# Altium project Phaser.PrjPCB (part 10 of 11)

## Sheet Attenuator.SchDoc: =DocumentName
size A4; SPICEModelCacheVGBTAUBO: <root> / <DocumentId>VGBTAUBO</DocumentId> / </root>; DocumentNumber: 1; Revision: 0; SheetNumber: 24; SheetTotal: 30
Used 4 times, as channels U_Attenuator0, U_Attenuator2, U_Attenuator1, U_Attenuator3. Parts and nets are listed once, with the designators drawn on the sheet.
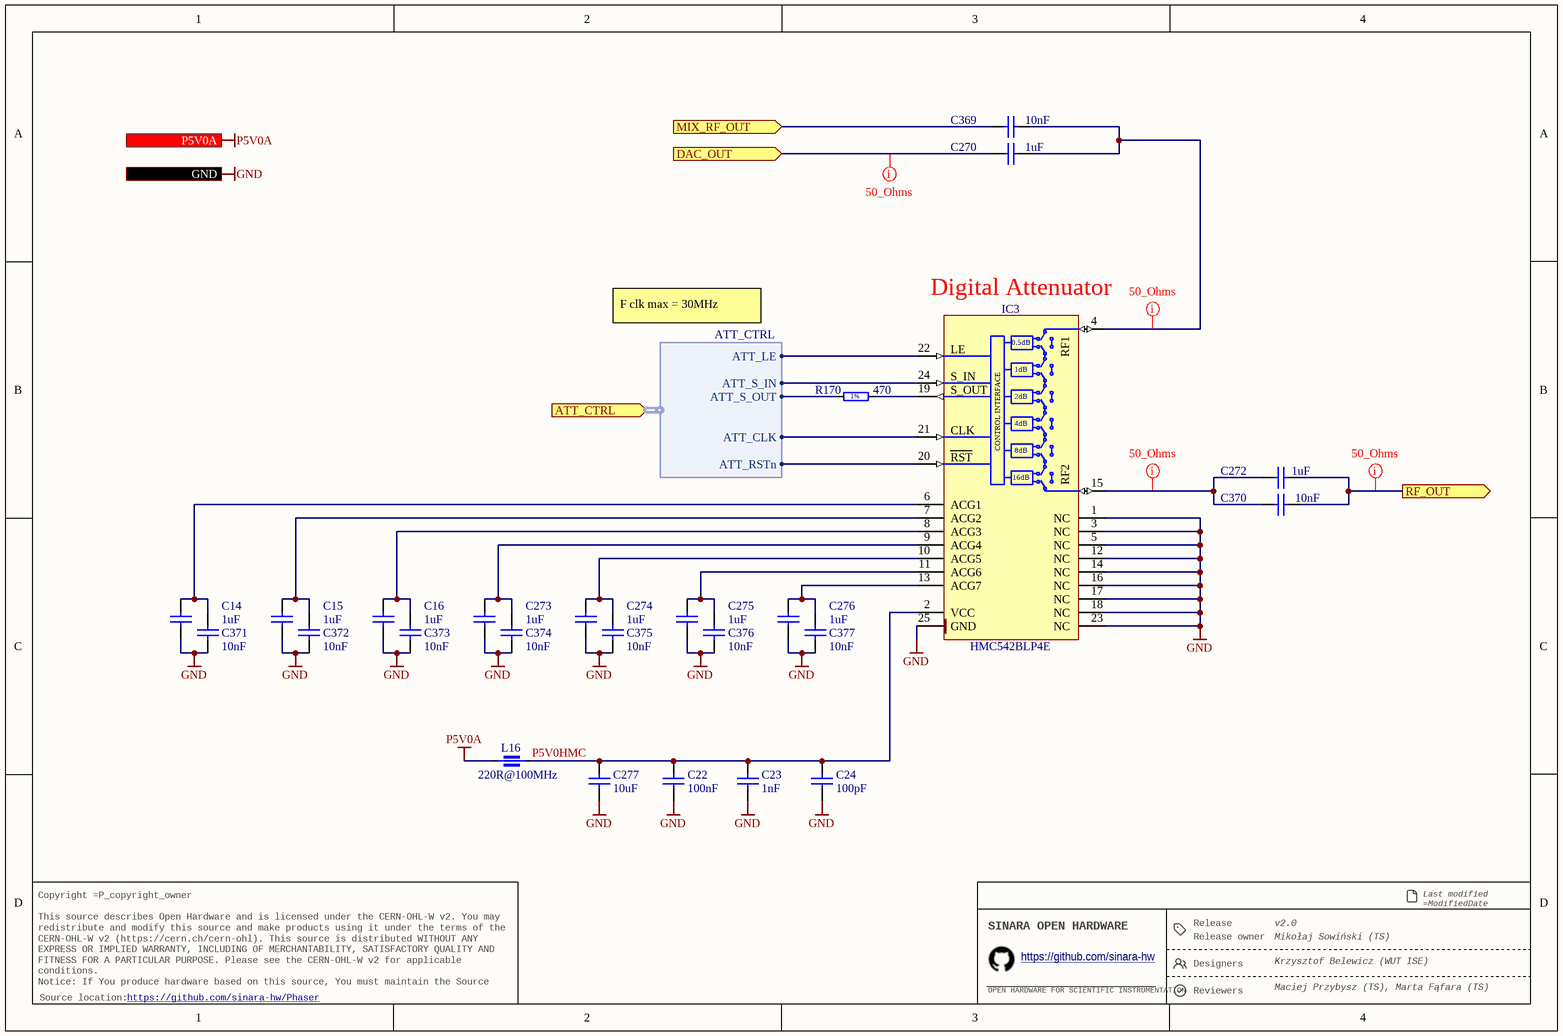
[diagram p28: Attenuator.SchDoc]

### Parts
C14  1uF  [CAPC1005X55N]
C15  1uF  [CAPC1005X55N]
C16  1uF  [CAPC1005X55N]
C22  100nF  [CAPC1005X55N]
C23  1nF  [CAPC1005X55N]
C24  100pF  [CAPC1005X55N]
C270  1uF  [CAPC1005X55N]
C272  1uF  [CAPC1005X55N]
C273  1uF  [CAPC1005X55N]
C274  1uF  [CAPC1005X55N]
C275  1uF  [CAPC1005X55N]
C276  1uF  [CAPC1005X55N]
C277  10uF  [CAPC2012X95N]
C369  10nF  [CAPC1005X55N]
C370  10nF  [CAPC1005X55N]
C371  10nF  [CAPC1005X55N]
C372  10nF  [CAPC1005X55N]
C373  10nF  [CAPC1005X55N]
C374  10nF  [CAPC1005X55N]
C375  10nF  [CAPC1005X55N]
C376  10nF  [CAPC1005X55N]
C377  10nF  [CAPC1005X55N]
IC3  HMC542BLP4E  [QFN50P400X400X100-25N-S295]
L16  220R@100MHz  [INDC1608X95N]
R170  470  [RESC1005X40N]

### Ports
ATT_CTRL (in, harness ATT_CTRL), DAC_OUT (in), GND, MIX_RF_OUT (in), P5V0A (in), RF_OUT (out)

### Harnesses
ATT_CTRL: ATT_CLK, ATT_LE, ATT_RSTn, ATT_S_IN, ATT_S_OUT

### Nets
GND: C14.1 C15.1 C16.1 C22.1 C23.1 C24.1 C273.1 C274.1 C275.1 C276.1 C277.1 C371.2 C372.2 C373.2 C374.2 C375.2 C376.2 C377.2 IC3.1(NC) IC3.3(NC) IC3.5(NC) IC3.12(NC) IC3.14(NC) IC3.16(NC) IC3.17(NC) IC3.18(NC) IC3.23(NC) IC3.25(GND) ; port GND
P5V0A: L16.1 ; port P5V0A
DAC_OUT: C270.2 ; port DAC_OUT
MIX_RF_OUT: C369.1 ; port MIX_RF_OUT
P5V0HMC: C22.2 C23.2 C24.2 C277.2 IC3.2(VCC) L16.2
RF_OUT: C272.1 C370.2 ; port RF_OUT
NetC14_2: C14.2 C371.1 IC3.6(ACG1)
NetC15_2: C15.2 C372.1 IC3.7(ACG2)
NetC16_2: C16.2 C373.1 IC3.8(ACG3)
NetC270_1: C270.1 C369.2 IC3.4(RF1)
NetC272_2: C272.2 C370.1 IC3.15(RF2)
NetC273_2: C273.2 C374.1 IC3.9(ACG4)
NetC274_2: C274.2 C375.1 IC3.10(ACG5)
NetC275_2: C275.2 C376.1 IC3.11(ACG6)
NetC276_2: C276.2 C377.1 IC3.13(ACG7)
NetIC3_19: IC3.19(SERIAL_OUTPUT) R170.2
NetIC3_20: IC3.20(~{RESET}) ; port ATT_CTRL.ATT_RSTn
NetIC3_21: IC3.21(SHIFT_CLOCK) ; port ATT_CTRL.ATT_CLK
NetIC3_22: IC3.22(LATCH_ENABLE) ; port ATT_CTRL.ATT_LE
NetIC3_24: IC3.24(SERIAL_INPUT) ; port ATT_CTRL.ATT_S_IN
NetR170_1: R170.1 ; port ATT_CTRL.ATT_S_OUT

### Channels
U_Attenuator0: designators end in A; ports DAC_OUT=NetC270A_2 GND=GND MIX_RF_OUT=NetC369A_1 P5V0A=P5V0A RF_OUT=NetC272A_1
U_Attenuator2: designators end in C; ports DAC_OUT=NetC270C_2 GND=GND MIX_RF_OUT=GND P5V0A=P5V0A RF_OUT=NetC272C_1
U_Attenuator1: designators end in B; ports DAC_OUT=NetC270B_2 GND=GND MIX_RF_OUT=NetC369B_1 P5V0A=P5V0A RF_OUT=NetC272B_1
U_Attenuator3: designators end in D; ports DAC_OUT=NetC270D_2 GND=GND MIX_RF_OUT=GND P5V0A=P5V0A RF_OUT=NetC272D_1

### Layout directives
net class 50_Ohms: NetC270A_1, NetC270A_2, NetC272A_1, NetC272A_2

### Notes on the sheet
- (near IC3) Digital Attenuator
- F clk max = 30MHz
- Release
- Last modified =ModifiedDate
  Sheet =sheetnumber of =sheettotal · Size A4
- Copyright =P_copyright_owner
  This source describes Open Hardware and is licensed under the CERN-OHL-W v2. You may redistribute and modify this source and make products using it under the terms of the CERN-OHL-W v2 (https://cern.ch/cern-ohl). This source is distributed WITHOUT ANY EXPRESS OR IMPLIED WARRANTY, INCLUDING OF MERCHANTABILITY, SATISFACTORY QUALITY AND FITNESS FOR A PARTICULAR PURPOSE. Please see the CERN-OHL-W v2 for applicable conditions.
  Notice: If You produce hardware based on this source, You must maintain the Source Location visible on the product, its packaging or its documentation.
- SINARA OPEN HARDWARE
- OPEN HARDWARE FOR SCIENTIFIC INSTRUMENTATION
- https://github.com/sinara-hw
- Release owner
- Designers
- Reviewers
- Source location:
- (in symbol HMC542BLP4E) 0.5dB; LE; 1dB; S_IN; S_OUT; 2dB; CONTROL INTERFACE; 4dB; CLK; 8dB; RST; 16dB
- (in symbol R0402_470R_1%_0.0625W_100PPM) 1%

### Library data of the parts
C14-C16 C270 C272-C276 = CC0402_1UF_16V_10%_X5R: Non-polarised capacitor; Part Description: SMD Multilayer Chip Ceramic Capacitor; Manufacturer: GENERIC; Manufacturer1 Part Number: C1005X5R1C105KT; Voltage: 16V; TC: X5R; Tolerance: ±10%; Part Number: CC0402_1UF_16V_10%_X5R; Component Kind: Standard; Component Type: Standard; Pin Count: 2; Value: 1uF; Status: Preferred; Manufacturer Part Number: CC0402_1UF_16V_10%_X5R; Case: 0402; Mounted: Yes; Socket: No; SMD: Yes; Sense: No; Manufacturer1 Example: TDK; Manufacturer1 ComponentHeight: 0.55mm; HelpURL: \\cern.ch\dfs\Applications\Altium\Datasheets\CC0402_X5R_TDK_C.pdf; Author: CERN DEM JLC; CreateDate: 25.10.2012; LatestRevisionDate: 25.10.2012
C22 = CC0402_100NF_50V_10%_X7R: Non-polarised capacitor; Part Description: SMD Multilayer Chip Ceramic Capacitor; Manufacturer: GENERIC; Manufacturer1 Part Number: GRM155R71H104KE14D; Voltage: 50V; TC: X7R; Tolerance: ±10%; Part Number: CC0402_100NF_50V_10%_X7R; Component Kind: Standard; Component Type: Standard; Pin Count: 2; Value: 100nF; Status: None; Manufacturer Part Number: CC0402_100NF_50V_10%_X7R; Case: 0402; Mounted: Yes; Socket: No; SMD: Yes; Sense: No; Manufacturer1 Example: MURATA; Manufacturer1 ComponentHeight: 0.55mm; HelpURL: \\cern.ch\dfs\Applications\Altium\Datasheets\CC0402_MURATA_GRM155R71H104KE14D.pdf; Author: CERN DEM MR; CreateDate: 30.06.2017; LatestRevisionDate: 30.06.2017
C23 = CC0402_1NF_50V_10%_X7R: Non-polarised capacitor; Part Description: SMD Multilayer Chip Ceramic Capacitor; Manufacturer: GENERIC; Manufacturer1 Part Number: 223858715623; Voltage: 50V; TC: X7R; Tolerance: ±10%; Part Number: CC0402_1NF_50V_10%_X7R; Component Kind: Standard; Component Type: Standard; Pin Count: 2; Value: 1nF; Status: Not Recommended; Manufacturer Part Number: CC0402_1NF_50V_10%_X7R; Case: 0402; Mounted: Yes; Socket: No; SMD: Yes; Sense: No; Manufacturer1 Example: PHYCOMP; Manufacturer1 ComponentHeight: 0.55mm; HelpURL: \\cern.ch\dfs\Applications\Altium\Datasheets\CC0402_X7R_PHYCOMP.pdf; Author: CERN DEM JLC; CreateDate: 2007-12-03; LatestRevisionDate: 2007-12-03
C24 = CC0402_100PF_50V_5%_C0G: Non-polarised capacitor; Part Description: SMD Multilayer Chip Ceramic Capacitor; Manufacturer: GENERIC; Manufacturer1 Part Number: C0402C101J5GACTU; Voltage: 50V; TC: C0G/NP0; Tolerance: ±5%; Part Number: CC0402_100PF_50V_5%_C0G; Component Kind: Standard; Component Type: Standard; Pin Count: 2; Value: 100pF; Status: Preferred; Manufacturer Part Number: CC0402_100PF_50V_5%_C0G; Case: 0402; Mounted: Yes; Socket: No; SMD: Yes; Sense: No; Manufacturer1 Example: KEMET; Manufacturer1 ComponentHeight: 0.55mm; HelpURL: \\cern.ch\dfs\Applications\Altium\Datasheets\CC0805_C0G_KEMET_(Commercial Grade).pdf; Author: CERN DEM JLC; CreateDate: 2007-12-03; LatestRevisionDate: 2015-04-22
C277 = CC0805_10UF_25V_10%_X5R: Non-polarised capacitor; Part Description: SMD Multilayer Chip Ceramic Capacitor; Manufacturer: GENERIC; Manufacturer1 Part Number: GRM219R61E106KA12D; Voltage: 25V; TC: X5R; Tolerance: ±10%; Part Number: CC0805_10UF_25V_10%_X5R; Component Kind: Standard; Component Type: Standard; Pin Count: 2; Value: 10uF; Status: Preferred; Manufacturer Part Number: CC0805_10UF_25V_10%_X5R; Case: 0805; Mounted: Yes; Socket: No; SMD: Yes; Sense: No; Manufacturer1 Example: MURATA; Manufacturer1 ComponentHeight: 0.95mm; HelpURL: \\cern.ch\dfs\Applications\Altium\Datasheets\CC0805_X5R_MURATA_GRM.pdf; Author: CERN DEM JLC; CreateDate: 25.10.2012; LatestRevisionDate: 06.09.2016
C369-C377 = CC0402_10NF_50V_5%_X7R: Non-polarised capacitor; Part Description: SMD Multilayer Chip Ceramic Capacitor; Manufacturer: GENERIC; Manufacturer1 Part Number: C0402C103J5RAC; Voltage: 50V; TC: X7R; Tolerance: ±5%; Part Number: CC0402_10NF_50V_5%_X7R; Component Kind: Standard; Component Type: Standard; Pin Count: 2; Value: 10nF; Status: Preferred; Manufacturer Part Number: CC0402_10NF_50V_5%_X7R; Case: 0402; Mounted: Yes; Socket: No; SMD: Yes; Sense: No; Manufacturer1 Example: KEMET; Manufacturer1 ComponentHeight: 0.55mm; HelpURL: \\cern.ch\dfs\Applications\Altium\Datasheets\CC0402_X7R_KEMET.pdf; Author: CERN DEM BC; CreateDate: 15.07.2020; LatestRevisionDate: 15.07.2020
IC3 = HMC542BLP4E: 0.5dB LSB GaAs MMIC 6-bit Digital Serial Control Attenuator, DC - 4GHz; Part Description: 0.5dB LSB GaAs MMIC 6-bit Digital Serial Control Attenuator, DC to 4GHz; Manufacturer: HITTITE MICROWAVE CORP; PressFit: No; Bonding: No; Part Number: HMC542BLP4E; Component Kind: Standard; Component Type: Standard; Device: HMC542BLP4E; PackageDescription: QFN, 0.50mm Pitch, Square; 24 Pin, 4.00mm L X 4.00mm W X 1.00mm H Body (w/thermal Tab 2.95 X 2.95mm), IPC Medium Density; Manufacturer Part Number: HMC542BLP4E; Pin Count: 25; Case: QFN24; Mounted: Yes; Socket: No; SMD: Yes; Sense: No; ComponentHeight: 1mm; Author: CERN DEM JMW; HelpURL: \\cern.ch\dfs\Applications\Altium\Datasheets\HMC542BLP4E.pdf; CreateDate: 2016-08-17; LatestRevisionDate: 2016-08-17
L16 = IND0603_MURATA_BLM18SG221TN1: Part Description: SMD EMIFIL Suppression Chip Ferrite Bead; Manufacturer: MURATA; Power: 2.5A; Resistance: 0.04R; Tolerance: ±25%; Part Number: IND0603_MURATA_BLM18SG221TN1; Component Kind: Standard; Component Type: Standard; Pin Count: 2; Value: 220R@100MHz; Status: None; Manufacturer Part Number: BLM18SG221TN1; Case: 0603; Mounted: Yes; Socket: No; SMD: Yes; Sense: No; ComponentHeight: 0.95mm; HelpURL: \\cern.ch\dfs\Applications\Altium\Datasheets\IND0603_MURATA_BLM18S.pdf; Author: CERN DEM MR; CreateDate: 08.01.2016; LatestRevisionDate: 25.10.2018
R170 = R0402_470R_1%_0.0625W_100PPM: Resistor - 1%; Part Description: General Purpose Thick Film Chip Resistor; Manufacturer: GENERIC; Manufacturer1 Part Number: 232270674701L; TC: ±100ppm/°C; PressFit: No; Part Number: R0402_470R_1%_0.0625W_100PPM; Component Kind: Standard; Component Type: Standard; Pin Count: 2; Value: 470; Status: Not Recommended; Power: 0.0625W; Tolerance: ±1%; Manufacturer Part Number: R0402_470R_1%_0.0625W_100PPM; Case: 0402; Mounted: Yes; Sense: No; Socket: No; SMD: Yes; Manufacturer1 Example: YAGEO PHYCOMP; Manufacturer1 ComponentHeight: 0.4mm; HelpURL: \\cern.ch\dfs\Applications\Altium\Datasheets\R0402_Phycomp_RC0402.pdf; Author: CERN DEM JLC; CreateDate: 03.12.2007; LatestRevisionDate: 17.10.2012

## Sheet JTAG_Switch.SchDoc: =DocumentName
size A3; SPICEModelCacheVGBTAUBO: <root> / <DocumentId>VGBTAUBO</DocumentId> / </root>; DocumentNumber: 1; Revision: 0; SheetNumber: 11; SheetTotal: 30
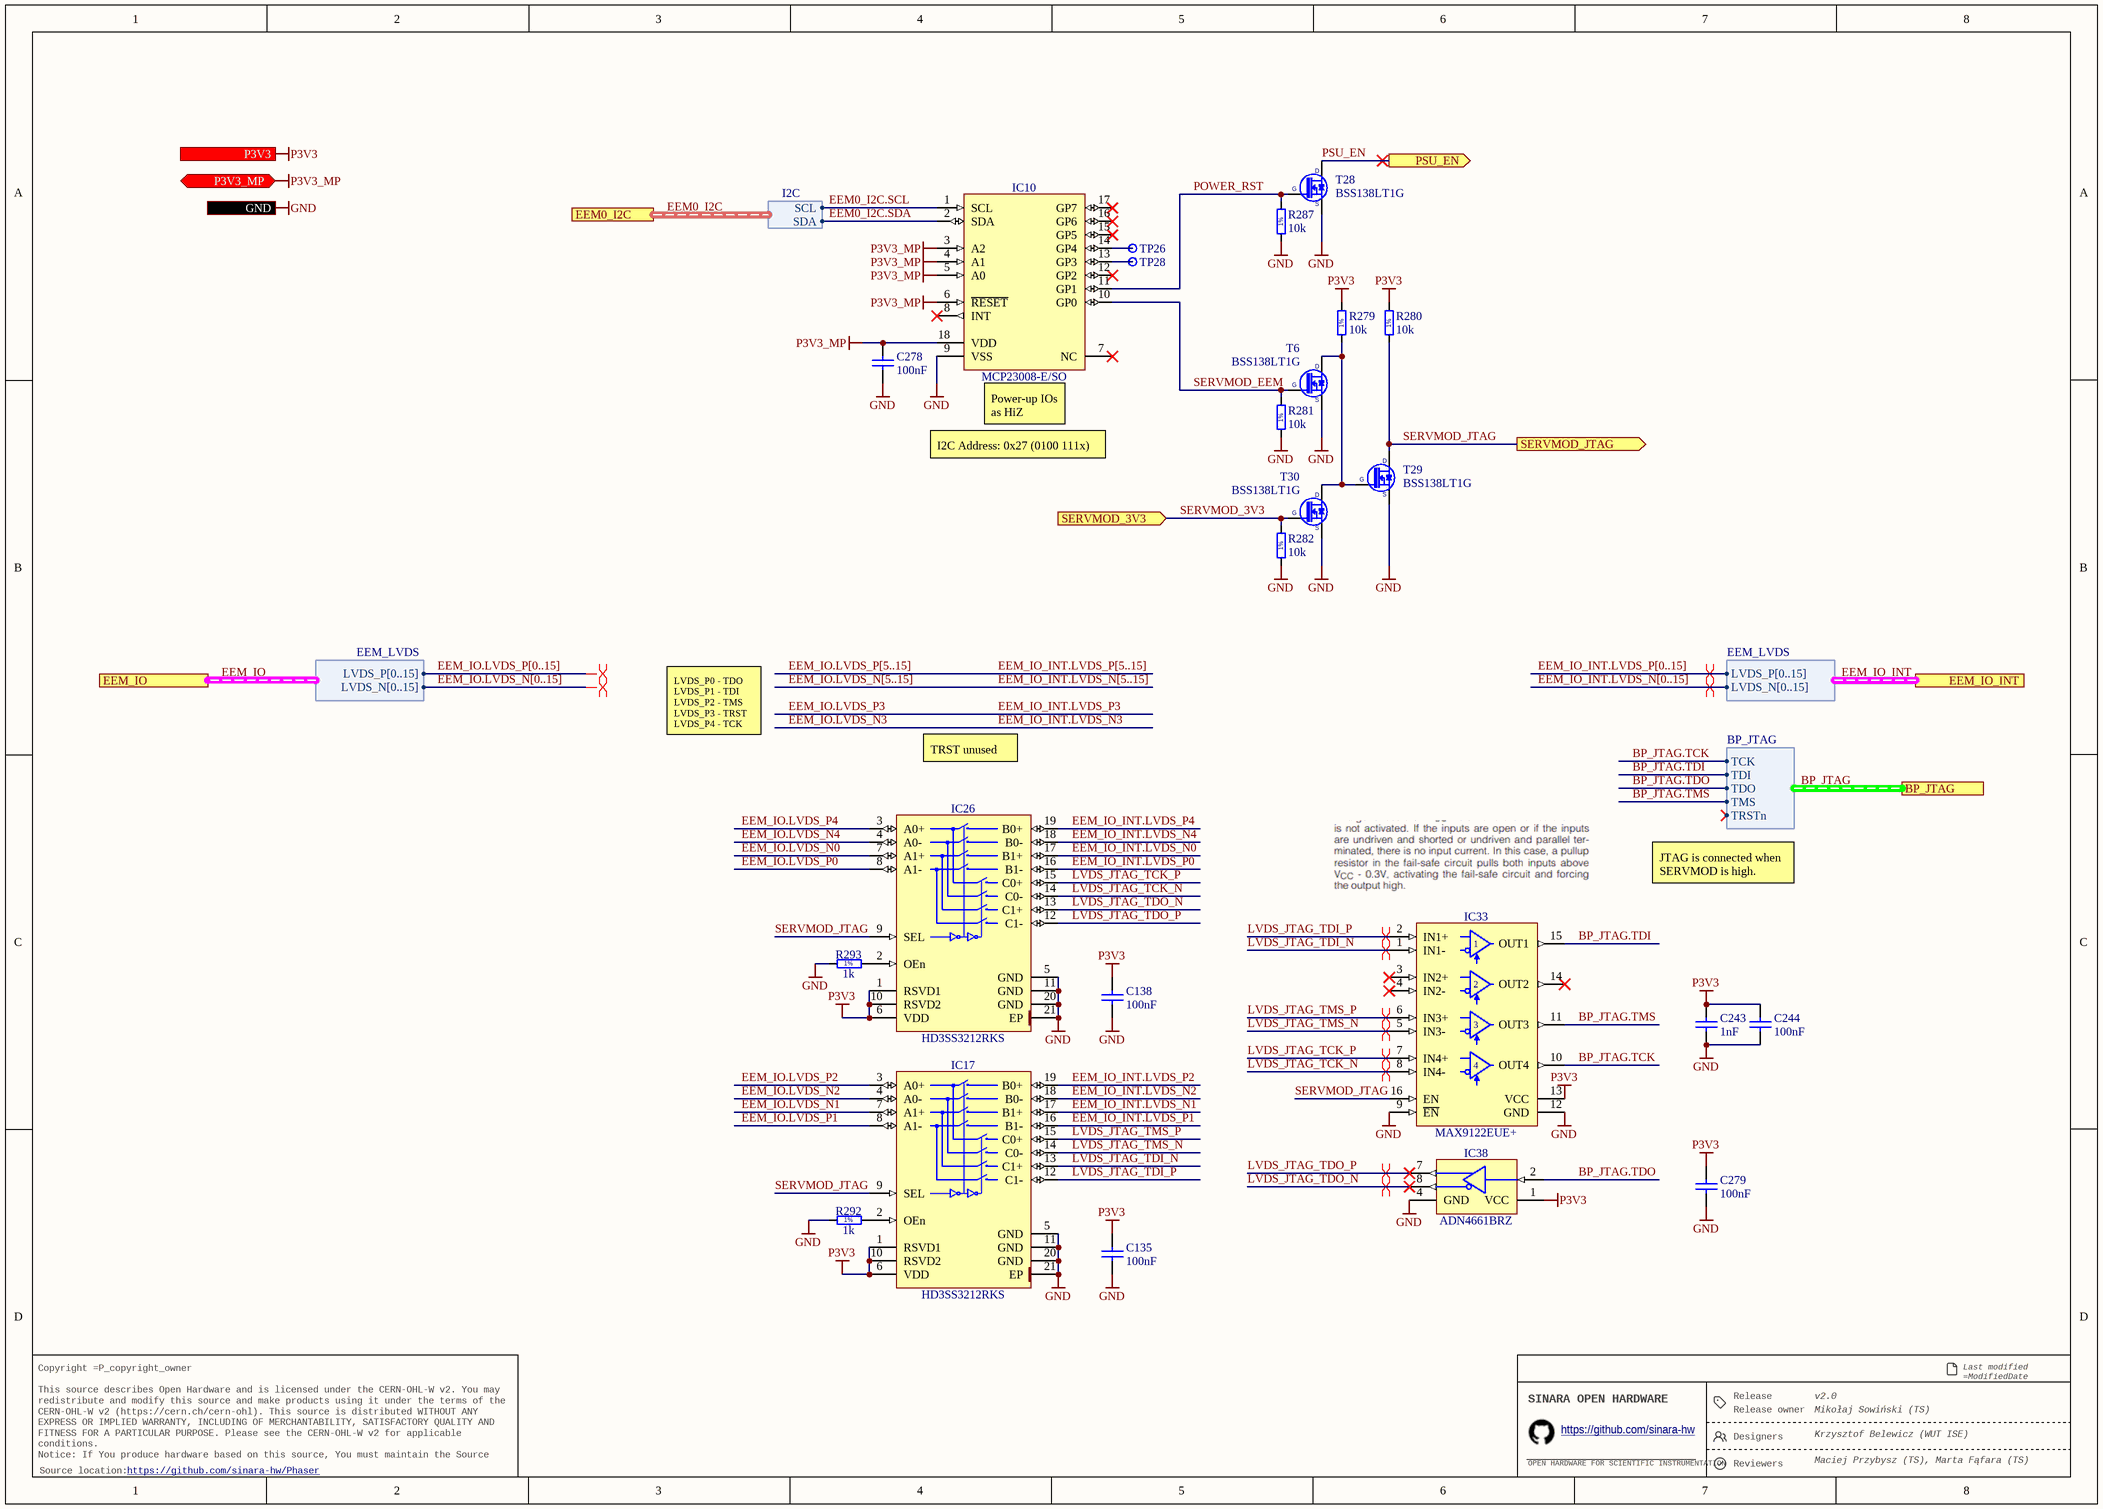
[diagram p29: JTAG_Switch.SchDoc]

### Parts
C135  100nF  [CAPC1005X55N]
C138  100nF  [CAPC1005X55N]
C243  1nF  [CAPC1005X55N]
C244  100nF  [CAPC1005X55N]
C278  100nF  [CAPC1005X55N]
C279  100nF  [CAPC1005X55N]
IC10  MCP23008-E/SO  [SOIC127P1030X265-18N]
IC17  HD3SS3212RKS  [TEXAS_RKS0020A]
IC26  HD3SS3212RKS  [TEXAS_RKS0020A]
IC33  MAX9122EUE+  [SOP65P640X110-16N]
IC38  ADN4661BRZ  [SOIC127P600X175-8N]
R279  10k  [RESC1005X40N]
R280  10k  [RESC1005X40N]
R281  10k  [RESC1005X40N]
R282  10k  [RESC1005X40N]
R287  10k  [RESC1005X40N]
R292  1k  [RESC1005X40N]
R293  1k  [RESC1005X40N]
T6  BSS138LT1G  [SOT95P240X110-3N]
T28  BSS138LT1G  [SOT95P240X110-3N]
T29  BSS138LT1G  [SOT95P240X110-3N]
T30  BSS138LT1G  [SOT95P240X110-3N]
TP26  Test Point  [TPS127]  (value not drawn)  (no BOM)
TP28  Test Point  [TPS127]  (value not drawn)  (no BOM)

### Ports
BP_JTAG (harness BP_JTAG), EEM0_I2C (harness I2C), EEM_IO (harness EEM_LVDS), EEM_IO_INT (harness EEM_LVDS), GND, P3V3 (out), P3V3_MP (bidir), PSU_EN (out), SERVMOD_3V3 (in), SERVMOD_JTAG (out)

### Harnesses
EEM_LVDS: LVDS_P[0..15], LVDS_N[0..15]
BP_JTAG: TCK, TDI, TDO, TMS, TRSTn
I2C: SDA, SCL

### Nets
GND: C135.1 C138.1 C243.1 C244.1 C278.1 C279.1 IC10.9(VSS) IC17.5(GND) IC17.11(GND) IC17.20(GND) IC17.21(EP) IC26.5(GND) IC26.11(GND) IC26.20(GND) IC26.21(EP) IC33.9(~{EN}) IC33.12(GND) IC38.4(GND) R281.2 R282.2 R287.2 R292.2 R293.2 T6.2(S) T28.2(S) T29.2(S) T30.2(S) ; port GND
P3V3: C135.2 C138.2 C243.2 C244.2 C279.2 IC17.1(RSVD1) IC17.6(VDD) IC17.10(RSVD2) IC26.1(RSVD1) IC26.6(VDD) IC26.10(RSVD2) IC33.13(VCC) IC38.1(VCC) R279.1 R280.1 ; port P3V3
P3V3_MP: C278.2 IC10.3(A2) IC10.4(A1) IC10.5(A0) IC10.6(~{RESET}) IC10.18(VDD) ; port P3V3_MP
BP_JTAG.TCK: IC33.10(OUT4) ; port BP_JTAG.TCK
BP_JTAG.TDI: IC33.15(OUT1) ; port BP_JTAG.TDI
BP_JTAG.TDO: IC38.2(DIN) ; port BP_JTAG.TDO
BP_JTAG.TMS: IC33.11(OUT3) ; port BP_JTAG.TMS
EEM0_I2C.SCL: IC10.1(SCL) ; port EEM0_I2C.SCL
EEM0_I2C.SDA: IC10.2(SDA) ; port EEM0_I2C.SDA
EEM_IO.LVDS_N0: IC26.7(A1+)
EEM_IO.LVDS_N1: IC17.7(A1+)
EEM_IO.LVDS_N2: IC17.4(A0-)
EEM_IO.LVDS_N4: IC26.4(A0-)
EEM_IO.LVDS_P0: IC26.8(A1-)
EEM_IO.LVDS_P1: IC17.8(A1-)
EEM_IO.LVDS_P2: IC17.3(A0+)
EEM_IO.LVDS_P4: IC26.3(A0+)
EEM_IO_INT.LVDS_N0: IC26.17(B1+)
EEM_IO_INT.LVDS_N1: IC17.17(B1+)
EEM_IO_INT.LVDS_N2: IC17.18(B0-)
EEM_IO_INT.LVDS_N4: IC26.18(B0-)
EEM_IO_INT.LVDS_P0: IC26.16(B1-)
EEM_IO_INT.LVDS_P1: IC17.16(B1-)
EEM_IO_INT.LVDS_P2: IC17.19(B0+)
EEM_IO_INT.LVDS_P4: IC26.19(B0+)
LVDS_JTAG_TCK_N: IC26.14(C0-) IC33.8(IN4-)
LVDS_JTAG_TCK_P: IC26.15(C0+) IC33.7(IN4+)
LVDS_JTAG_TDI_N: IC17.13(C1+) IC33.1(IN1-)
LVDS_JTAG_TDI_P: IC17.12(C1-) IC33.2(IN1+)
LVDS_JTAG_TDO_N: IC26.13(C1+) IC38.8(DOUT-)
LVDS_JTAG_TDO_P: IC26.12(C1-) IC38.7(DOUT+)
LVDS_JTAG_TMS_N: IC17.14(C0-) IC33.5(IN3-)
LVDS_JTAG_TMS_P: IC17.15(C0+) IC33.6(IN3+)
POWER_RST: IC10.11(GP1) R287.1 T28.1(G)
PSU_EN: T28.3(D) ; port PSU_EN
SERVMOD_3V3: R282.1 T30.1(G) ; port SERVMOD_3V3
SERVMOD_EEM: IC10.10(GP0) R281.1 T6.1(G)
SERVMOD_JTAG: IC17.9(SEL) IC26.9(SEL) IC33.16(EN) R280.2 T29.3(D) ; port SERVMOD_JTAG
NetIC10_13: IC10.13(GP3) TP28.1
NetIC10_14: IC10.14(GP4) TP26.1
NetIC17_2: IC17.2(OEn) R292.1
NetIC26_2: IC26.2(OEn) R293.1
NetR279_2: R279.2 T6.3(D) T29.1(G) T30.3(D)

Not connected (* = marked no-connect by the designer): IC10 7(NC)* 8(INT)* 12(GP2)* 15(GP5)* 16(GP6)* 17(GP7)*; IC33 3(IN2+)* 4(IN2-)* 14(OUT2)*; IC38 3(NC) 5(NC) 6(NC)

### Buses and harness runs
bus EEM_IO.LVDS_N[0..15]
bus EEM_IO.LVDS_N[5..15] = EEM_IO_INT.LVDS_N[5..15]
bus EEM_IO.LVDS_P[0..15]
bus EEM_IO.LVDS_P[5..15] = EEM_IO_INT.LVDS_P[5..15]
bus EEM_IO_INT.LVDS_N[0..15]
bus EEM_IO_INT.LVDS_P[0..15]
harness BP_JTAG = port BP_JTAG
harness EEM0_I2C = port EEM0_I2C
harness EEM_IO = port EEM_IO
harness EEM_IO_INT = port EEM_IO_INT

### Layout directives
differential pair; differential pair class Diff_100Ohm: (no net found under the mark), LVDS_JTAG_TCK_N, LVDS_JTAG_TCK_P, LVDS_JTAG_TDI_N, LVDS_JTAG_TDI_P, LVDS_JTAG_TDO_N, LVDS_JTAG_TDO_P, LVDS_JTAG_TMS_N, LVDS_JTAG_TMS_P

### Notes on the sheet
- I2C Address: 0x27 (0100 111x)
- (near IC10) Power-up IOs as HiZ
- LVDS_P0 - TDO
  LVDS_P1 - TDI
  LVDS_P2 - TMS
  LVDS_P3 - TRST
  LVDS_P4 - TCK
- TRST unused
- JTAG is connected when SERVMOD is high.
- Release
- Last modified =ModifiedDate
  Sheet =sheetnumber of =sheettotal · Size A3
- Copyright =P_copyright_owner
  This source describes Open Hardware and is licensed under the CERN-OHL-W v2. You may redistribute and modify this source and make products using it under the terms of the CERN-OHL-W v2 (https://cern.ch/cern-ohl). This source is distributed WITHOUT ANY EXPRESS OR IMPLIED WARRANTY, INCLUDING OF MERCHANTABILITY, SATISFACTORY QUALITY AND FITNESS FOR A PARTICULAR PURPOSE. Please see the CERN-OHL-W v2 for applicable conditions.
  Notice: If You produce hardware based on this source, You must maintain the Source Location visible on the product, its packaging or its documentation.
- SINARA OPEN HARDWARE
- OPEN HARDWARE FOR SCIENTIFIC INSTRUMENTATION
- https://github.com/sinara-hw
- Release owner
- Designers
- Reviewers
- Source location:
- (in symbol R0402_1K_1%_0.0625W_100PPM) 1%
- (in symbol R0402_10K_1%_0.0625W_100PPM) 1%

### Library data of the parts
C135 C138 C244 C278 C279 = CC0402_100NF_50V_10%_X7R: as C22 on sheet Attenuator; Part Number: CC0402_100NF_50V_10%_X7R; Component Kind: Standard; Component Type: Standard; Pin Count: 2; Value: 100nF; Status: None; Manufacturer Part Number: CC0402_100NF_50V_10%_X7R; Case: 0402; Mounted: Yes; Socket: No; SMD: Yes; Sense: No; Manufacturer1 Example: MURATA; Manufacturer1 ComponentHeight: 0.55mm; HelpURL: \\cern.ch\dfs\Applications\Altium\Datasheets\CC0402_MURATA_GRM155R71H104KE14D.pdf; Author: CERN DEM MR; CreateDate: 30.06.2017; LatestRevisionDate: 30.06.2017
C243 = CC0402_1NF_50V_10%_X7R: as C23 on sheet Attenuator; Part Number: CC0402_1NF_50V_10%_X7R; Component Kind: Standard; Component Type: Standard; Pin Count: 2; Value: 1nF; Status: Not Recommended; Manufacturer Part Number: CC0402_1NF_50V_10%_X7R; Case: 0402; Mounted: Yes; Socket: No; SMD: Yes; Sense: No; Manufacturer1 Example: PHYCOMP; Manufacturer1 ComponentHeight: 0.55mm; HelpURL: \\cern.ch\dfs\Applications\Altium\Datasheets\CC0402_X7R_PHYCOMP.pdf; Author: CERN DEM JLC; CreateDate: 2007-12-03; LatestRevisionDate: 2007-12-03
IC10 = MCP23008-E/SO: 8-Bit I/O Expander with Serial Interface; Manufacturer: MICROCHIP TECHNOLOGY; PressFit: No; Bonding: No; Part Number: MCP23008-E/SO; Component Kind: Standard; Component Type: Standard; Device: MCP23008-E/SO; PackageDescription: SOIC, 18-Leads, Body 13.9x7.6mm (max), Pitch 1.27mm, IPC Medium Density; Part Description: 8-Bit I/O Expander with Serial Interface; Manufacturer Part Number: MCP23008-E/SO; Pin Count: 18; Case: SOIC18; Mounted: Yes; Socket: No; SMD: Yes; Sense: No; ComponentHeight: 2.65mm; Author: CERN DEM JLC; HelpURL: \\cern.ch\dfs\Applications\Altium\Datasheets\MCP23008-E-SO.pdf; CreateDate: 30/10/2012; LatestRevisionDate: 30/10/2012
IC17 IC26 = HD3SS3212RKS: Two-Channel Differential 2:1/1:2 USB3.1 Mux/Demux; Manufacturer: TEXAS INSTRUMENTS; PressFit: No; Bonding: No; Part Number: HD3SS3212RKS; Component Kind: Standard; Component Type: Standard; Device: HD3SS3212RKS; PackageDescription: QFN, TEXAS Case Style RKS, 0.50mm Pitch, Rect.; 20 Pin, 2.50mm L X 4.50mm W X 1.00mm H body (w/Thermal Tab 1.1mm X 3.1mm); Part Description: Two-Channel Differential 2:1/1:2 USB3.1 Mux/Demux; Manufacturer Part Number: HD3SS3212RKS; Pin Count: 21; Case: TQFN20; Mounted: Yes; Socket: No; SMD: Yes; Sense: No; ComponentHeight: 1mm; Author: CERN DEM BC; HelpURL: \\cern.ch\dfs\Applications\Altium\Datasheets\HD3SS3212RKS.pdf; CreateDate: 2019-11-06; LatestRevisionDate: 2019-11-06
IC33 = MAX9122EUE+: Quad LVDS Line Receivers with Integrated Termination and Flow-Through Pinout; Manufacturer: MAXIM; PressFit: No; Bonding: No; Part Number: MAX9122EUE+; Component Kind: Standard; Component Type: Standard; Device: MAX9122EUE+; PackageDescription: SOP, 0.65mm Pitch; 16 Pin, 4.40mm W X 5.00mm L X 1.10mm H body, IPC Medium Density; Part Description: Quad LVDS Line Receivers with Integrated Termination and Flow-Through Pinout; Manufacturer Part Number: MAX9122EUE+; Pin Count: 16; Case: TSSOP16; Mounted: Yes; Socket: No; SMD: Yes; Sense: No; ComponentHeight: 1.1mm; Author: CERN DEM MR; HelpURL: \\cern.ch\dfs\Applications\Altium\Datasheets\MAX9122EUE+.pdf; CreateDate: 2015-12-14; LatestRevisionDate: 2015-12-14
IC38 = ADN4661BRZ: Single, 3V, CMOS, LVDS, High Speed Differential Driver; Manufacturer: ANALOG DEVICES; PressFit: No; Bonding: No; Part Number: ADN4661BRZ; Component Kind: Standard; Component Type: Standard; Device: ADN4661BRZ; PackageDescription: SOIC 8, Pitch 1.27mm - Body 4x5mm, IPC Medium Density; Part Description: Single, 3V, CMOS, LVDS, High Speed Differential Driver; Manufacturer Part Number: ADN4661BRZ; Pin Count: 8; Case: SOIC8; Mounted: Yes; Socket: No; SMD: Yes; Sense: No; ComponentHeight: 1.75mm; Author: CERN DEM JMW; HelpURL: \\cern.ch\dfs\Applications\Altium\Datasheets\ADN4661BRZ.pdf; CreateDate: 2014-02-26; LatestRevisionDate: 2014-02-26
R279-R282 R287 = R0402_10K_1%_0.0625W_100PPM: Resistor - 1%; Part Description: General Purpose Thick Film Chip Resistor; Manufacturer: GENERIC; Manufacturer1 Part Number: 232270671003L; TC: ±100ppm/°C; Part Number: R0402_10K_1%_0.0625W_100PPM; Component Kind: Standard; Component Type: Standard; Pin Count: 2; Value: 10k; Status: Not recommended; Power: 0.0625W; Tolerance: ±1%; Manufacturer Part Number: R0402_10K_1%_0.0625W_100PPM; Case: 0402; Mounted: Yes; Sense: No; Socket: No; SMD: Yes; Manufacturer1 Example: YAGEO PHYCOMP; Manufacturer1 ComponentHeight: 0.4mm; HelpURL: \\cern.ch\dfs\Applications\Altium\Datasheets\R0402_Phycomp_RC0402.pdf; Author: CERN DEM JLC; CreateDate: 03.12.2007; LatestRevisionDate: 17.10.2012
R292 R293 = R0402_1K_1%_0.0625W_100PPM: Resistor - 1%; Part Description: General Purpose Thick Film Chip Resistor; Manufacturer: GENERIC; Manufacturer1 Part Number: 232270671002L; TC: ±100ppm/°C; PressFit: No; Part Number: R0402_1K_1%_0.0625W_100PPM; Component Kind: Standard; Component Type: Standard; Pin Count: 2; Value: 1k; Status: Not Recommended; Power: 0.0625W; Tolerance: ±1%; Manufacturer Part Number: R0402_1K_1%_0.0625W_100PPM; Case: 0402; Mounted: Yes; Sense: No; Socket: No; SMD: Yes; Manufacturer1 Example: YAGEO PHYCOMP; Manufacturer1 ComponentHeight: 0.4mm; HelpURL: \\cern.ch\dfs\Applications\Altium\Datasheets\R0402_Phycomp_RC0402.pdf; Author: CERN DEM JLC; CreateDate: 2007-12-03; LatestRevisionDate: 2012-10-17
T6 T28-T30 = BSS138LT1G: N-CHANNEL MOSFET WITH DIODE; Part Description: 50V, 200mA N-Channel Enhancement Mode Field-Effect Transistor; Manufacturer: ON SEMICONDUCTOR; PressFit: No; Bonding: No; Part Number: BSS138LT1G; Component Kind: Standard; Component Type: Standard; Device: BSS138LT1G; PackageDescription: SOT23, 0.95mm Pitch; 3 Pin, 1.40mm W X 3.00mm L X 1.10mm H body, IPC Medium Density; Manufacturer Part Number: BSS138L; Pin Count: 3; Case: SOT23-3; Mounted: Yes; Socket: No; SMD: Yes; Sense: No; ComponentHeight: 1.11mm; HelpURL: \\cern.ch\dfs\Applications\Altium\Datasheets\BSS138LT1G.pdf; Author: CERN DEM JLC; CreateDate: 23.03.2009; LatestRevisionDate: 25.05.2022
TP26 TP28 = SMD_PAD_1.27X1.27MM: Part Description: 1.27mm x 1.27mm PCB Copper Area (SMD Test Point); Mounted: No; Part Number: SMD_PAD_1.27X1.27MM; Component Type: Standard (No BOM); Pin Count: 1; Family: Test Point; Socket: No; SMD: Yes; Sense: No; Status: None; ComponentHeight: 0mm; HelpURL: Undefined; Author: CERN DEM JLC; CreateDate: 12.01.2008; LatestRevisionDate: 12.01.2008; PackageDescription: 1.27mm x 1.27mm PCB Copper Area (SMD Test Point)

## Nets that join several sheets
GND: Power_Supplies (T_C1.1 T_C2.1 T_IC1.2 T_R7.1), Power-up_delay (9 pins), Power_main_DCDC (103 pins), LEDs (37 pins), Power_AFE_DCDC (21 pins), CPCIS_Connectors_P1_P6 (55 pins), DIOT_signal_routing (T_C22.1 T_C23.1 T_IC8.4), EEM_Connectors (34 pins), Temperature_monitoring (5 pins), Mechanical (T_C12.2 T_R26.2 T_R27.2), FPGA (10 pins), FPGA_Bank13-14 (R43.1), FPGA_Supply (167 pins), FPGA_Config (22 pins), FPGA_SDRAM (48 pins), FPGA_GTP (16 pins), U_FPGA/U_I2C switch_0 (T_C24A.1 T_C25A.1 T_IC9A.4 T_R69A.1), U_FPGA/U_I2C switch_1 (T_C24B.1 T_C25B.1 T_IC9B.4 T_R69B.1), FP_Connectors (31 pins), CLK_GEN (7 pins), U_Input_channel0 (20 pins), DAC (34 pins), U_Upconversion0 (53 pins), DAC_SUPPLY (114 pins), U_Input_channel1 (20 pins), ADC_2CH (29 pins), Upconversion_LO (IC34.3 J16.2 J17.2), U_Upconversion1 (53 pins), U_Attenuator0 (28 pins), U_Attenuator2 (29 pins), U_Attenuator1 (28 pins), U_Attenuator3 (29 pins), JTAG_Switch (27 pins)
MGTAVTT: FPGA_Supply (14 pins), FPGA_GTP (R191.2)
N11V5A: LEDs (R220.2 TP11.1), Power_AFE_DCDC (C366.2 D3.2 IC18.5 R53.2), U_Input_channel0 (8 pins), U_Input_channel1 (8 pins)
P1V0: Power_main_DCDC (C260.2 L42.2 R131.1 R155.2), LEDs (R182.2 TP13.1), FPGA_Supply (31 pins)
P1V2: Power_main_DCDC (C338.2 IC28.1 R146.2), LEDs (R183.2 TP14.1), FPGA_Supply (L18.1)
P1V2A: Power_main_DCDC (6 pins), LEDs (R205.2 TP1.1), DAC_SUPPLY (24 pins)
P1V2D: Power_main_DCDC (6 pins), LEDs (R142.2 TP24.1), DAC_SUPPLY (22 pins)
P1V5: Power_main_DCDC (7 pins), LEDs (R208.2 TP3.1), FPGA_Supply (14 pins), FPGA_SDRAM (31 pins)
P1V8: Power_main_DCDC (C336.2 L50.2 R148.2 R166.2), LEDs (R210.2 TP10.1), FPGA_Supply (C232.2 L4.1 L26.1)
P1V8A: Power_main_DCDC (C340.2 IC35.5 R159.2), LEDs (R96.2 TP5.1), CLK_GEN (L10.1)
P2V5: Power_main_DCDC (C361.2 IC29.4 R162.2), LEDs (R211.2 TP4.1), FPGA (R235.2 R236.2 R261.2), FPGA_Bank13-14 (R42.2), FPGA_Supply (45 pins), FPGA_Config (16 pins), FPGA_GTP (C238.1 OSC2.2 OSC2.6), CLK_GEN (SW2.2), ADC_2CH (C55.2 IC24.1 L8.2)
P3V3: Power_main_DCDC (14 pins), LEDs (R92.1 R214.2 TP7.1), FPGA (D9.3 R262.1 R276.1 W1.1), FPGA_Supply (12 pins), FPGA_Config (C48.2 IC39.2), FPGA_SDRAM (C172.2 IC9.7 IC9.10 R127.2), U_FPGA/U_I2C switch_0 (6 pins), U_FPGA/U_I2C switch_1 (6 pins), FP_Connectors (10 pins), U_Input_channel0 (R189A.2 R192A.2 R212A.2), DAC (R231.2), DAC_SUPPLY (L7.2), U_Input_channel1 (R189B.2 R192B.2 R212B.2), JTAG_Switch (15 pins)
P3V3_MP: Power_Supplies (T_R2.2 T_R8.2), Power-up_delay (6 pins), LEDs (T_R1.2 T_R5.2 TP25.1), DIOT_signal_routing (T_C22.2 T_C23.2 T_IC8.1 T_IC8.8), EEM_Connectors (5 pins), Temperature_monitoring (5 pins), U_FPGA/U_I2C switch_0 (T_C24A.2 T_IC9A.8), U_FPGA/U_I2C switch_1 (T_C24B.2 T_IC9B.8), JTAG_Switch (6 pins)
P3V3A: Power_main_DCDC (6 pins), LEDs (R213.2 TP6.1), U_Upconversion0 (7 pins), DAC_SUPPLY (L14.2 L17.2 L41.2), U_Upconversion1 (7 pins)
P3V6: Power_main_DCDC (C348.2 L48.2 L51.1 R200.2), LEDs (R215.2 TP15.1)
P5V0A: Power_main_DCDC (C155.2 C266.2 IC21.4 R130.2), LEDs (R216.2 TP16.1), U_Upconversion0 (L34A.1 L35A.2), ADC_2CH (8 pins), U_Upconversion1 (L34B.1 L35B.2), U_Attenuator0 (L16A.1), U_Attenuator2 (L16C.1), U_Attenuator1 (L16B.1), U_Attenuator3 (L16D.1)
P5V5: Power_main_DCDC (33 pins), LEDs (R217.2 TP8.1)
P11V5A: LEDs (R219.2 TP9.1), Power_AFE_DCDC (C179.2 D6.1 IC7.5 R20.2), U_Input_channel0 (7 pins), U_Input_channel1 (7 pins)
P12V0: Power_Supplies (T_C1.2 T_IC1.1 T_R4.1), Power-up_delay (T_R29.1), Power_main_DCDC (7 pins), LEDs (10 pins), Power_AFE_DCDC (C249.2 IC23.2), CPCIS_Connectors_P1_P6 (7 pins), EEM_Connectors (T_J1.28 T_J1.29 T_J2.28 T_J2.29), FPGA (C268.2 R278.1 T16.2)
REF_P1V7066: U_Input_channel0 (R72A.1 RN4A.5 RN4A.8), U_Input_channel1 (R72B.1 RN4B.5 RN4B.8), ADC_2CH (IC12.7 R7.2 RN1.7)
REF_P2V048: U_Input_channel0 (R138A.1), U_Input_channel1 (R138B.1), ADC_2CH (IC12.1 RN1.3 RN2.7)
ADC_CLKOUT_N: FPGA_Bank15-16 (IC4#1.K19), ADC_2CH (IC1.18)
ADC_CLKOUT_P: FPGA_Bank15-16 (IC4#1.K18), ADC_2CH (IC1.17)
ADC_CNVn_N: FPGA_Bank15-16 (IC4#1.J22), ADC_2CH (IC24.4 R55.1)
ADC_CNVn_P: FPGA_Bank15-16 (IC4#1.H22), ADC_2CH (IC24.3 R55.2)
ADC_IN0_N: U_Input_channel0 (C224A.2 C226A.2 R97A.2), ADC_2CH (IC1.2)
ADC_IN0_P: U_Input_channel0 (C226A.1 C227A.1 R58A.2), ADC_2CH (IC1.3)
ADC_IN1_N: U_Input_channel1 (C226B.1 C227B.1 R58B.2), ADC_2CH (IC1.7)
ADC_IN1_P: U_Input_channel1 (C224B.2 C226B.2 R97B.2), ADC_2CH (IC1.6)
ADC_SCK_N: FPGA_Bank15-16 (IC4#1.N22), ADC_2CH (IC1.22 R5.1)
ADC_SCK_P: FPGA_Bank15-16 (IC4#1.M22), ADC_2CH (IC1.21 R5.2)
ADC_SDOA_N: FPGA_Bank15-16 (IC4#1.K22), ADC_2CH (IC1.16)
ADC_SDOA_P: FPGA_Bank15-16 (IC4#1.K21), ADC_2CH (IC1.15)
ADC_SDOB_N: FPGA_Bank15-16 (IC4#1.M21), ADC_2CH (IC1.20)
ADC_SDOB_P: FPGA_Bank15-16 (IC4#1.L21), ADC_2CH (IC1.19)
ASSY_Variant: FPGA (R236.1 R244.2), FPGA_Bank15-16 (IC4#1.N19)
ATT_CLK0: FPGA_Bank34 (IC4#1.W5), U_Attenuator0 (IC3A.21)
ATT_CLK1: FPGA_Bank34 (IC4#1.T6), U_Attenuator1 (IC3B.21)
ATT_CLK2: FPGA_Bank34 (IC4#1.AB2), U_Attenuator2 (IC3C.21)
ATT_CLK3: FPGA_Bank34 (IC4#1.R4), U_Attenuator3 (IC3D.21)
ATT_LE0: FPGA_Bank34 (IC4#1.U5), U_Attenuator0 (IC3A.22)
ATT_LE1: FPGA_Bank34 (IC4#1.V3), U_Attenuator1 (IC3B.22)
ATT_LE2: FPGA_Bank34 (IC4#1.AA4), U_Attenuator2 (IC3C.22)
ATT_LE3: FPGA_Bank34 (IC4#1.R3), U_Attenuator3 (IC3D.22)
ATT_RST0n: FPGA_Bank34 (IC4#1.U6), U_Attenuator0 (IC3A.20)
ATT_RST1n: FPGA_Bank34 (IC4#1.V5), U_Attenuator1 (IC3B.20)
ATT_RST2n: FPGA_Bank34 (IC4#1.W6), U_Attenuator2 (IC3C.20)
ATT_RST3n: FPGA_Bank34 (IC4#1.T4), U_Attenuator3 (IC3D.20)
ATT_S_IN0: FPGA_Bank34 (IC4#1.V4), U_Attenuator0 (IC3A.24)
ATT_S_IN1: FPGA_Bank34 (IC4#1.R6), U_Attenuator1 (IC3B.24)
ATT_S_IN2: FPGA_Bank34 (IC4#1.AB7), U_Attenuator2 (IC3C.24)
ATT_S_IN3: FPGA_Bank34 (IC4#1.R2), U_Attenuator3 (IC3D.24)
ATT_S_OUT0: FPGA_Bank34 (IC4#1.AA3), U_Attenuator0 (R170A.1)
ATT_S_OUT1: FPGA_Bank34 (IC4#1.W4), U_Attenuator1 (R170B.1)
ATT_S_OUT2: FPGA_Bank34 (IC4#1.Y6), U_Attenuator2 (R170C.1)
ATT_S_OUT3: FPGA_Bank34 (IC4#1.T5), U_Attenuator3 (R170D.1)
BBI_N: DAC (C383.2 R17.1), U_Upconversion1 (IC2B.28 L29B.1 R49B.1)
BBI_N: DAC (C387.2 R69.1), U_Upconversion0 (IC2A.28 L29A.1 R49A.1)
BBI_P: DAC (C382.2 R3.1), U_Upconversion1 (IC2B.27 L31B.1 R49B.2)
BBI_P: DAC (C386.2 R68.1), U_Upconversion0 (IC2A.27 L31A.1 R49A.2)
BBQ_N: DAC (C385.2 R228.1), U_Upconversion1 (IC2B.9 L33B.1 R71B.2)
BBQ_N: DAC (C389.2 R230.1), U_Upconversion0 (IC2A.9 L33A.1 R71A.2)
BBQ_P: DAC (C384.2 R227.1), U_Upconversion1 (IC2B.10 L38B.1 R71B.1)
BBQ_P: DAC (C388.2 R229.1), U_Upconversion0 (IC2A.10 L38A.1 R71A.1)
BP_CLK.CLK_N: CPCIS_Connectors_P1_P6 (T_J4.F4), CLK_GEN (T_R12.1)
BP_CLK.CLK_P: CPCIS_Connectors_P1_P6 (T_J4.E4), CLK_GEN (T_R11.1)
BP_I2C.SCL: CPCIS_Connectors_P1_P6 (T_D2.3 T_J4.B2), DIOT_signal_routing (T_IC8.6)
BP_I2C.SDA: CPCIS_Connectors_P1_P6 (T_D2.1 T_J4.C2), DIOT_signal_routing (T_IC8.7)
BP_IO.LVDS_N0: CPCIS_Connectors_P1_P6 (T_J4.E3), DIOT_signal_routing (T_R51.1)
BP_IO.LVDS_N1: CPCIS_Connectors_P1_P6 (T_J4.B3), DIOT_signal_routing (T_R52.1)
BP_IO.LVDS_N2: CPCIS_Connectors_P1_P6 (T_J4.C4), DIOT_signal_routing (T_R53.1)
BP_IO.LVDS_N3: CPCIS_Connectors_P1_P6 (T_J4.L4), DIOT_signal_routing (T_R54.1)
BP_IO.LVDS_N4: CPCIS_Connectors_P1_P6 (T_J4.I4), DIOT_signal_routing (T_R55.1)
BP_IO.LVDS_N5: CPCIS_Connectors_P1_P6 (T_J4.K5), DIOT_signal_routing (T_R56.1)
BP_IO.LVDS_N6: CPCIS_Connectors_P1_P6 (T_J4.H5), DIOT_signal_routing (T_R57.1)
BP_IO.LVDS_N7: CPCIS_Connectors_P1_P6 (T_J4.F6), DIOT_signal_routing (T_R58.1)
BP_IO.LVDS_N8: CPCIS_Connectors_P1_P6 (T_J4.C6), DIOT_signal_routing (T_R59.1)
BP_IO.LVDS_N9: CPCIS_Connectors_P1_P6 (T_J4.L6), DIOT_signal_routing (T_R60.1)
BP_IO.LVDS_N10: CPCIS_Connectors_P1_P6 (T_J4.I6), DIOT_signal_routing (T_R61.1)
BP_IO.LVDS_N11: CPCIS_Connectors_P1_P6 (T_J5.E1), DIOT_signal_routing (T_R62.1)
BP_IO.LVDS_N12: CPCIS_Connectors_P1_P6 (T_J5.B1), DIOT_signal_routing (T_R63.1)
BP_IO.LVDS_N13: CPCIS_Connectors_P1_P6 (T_J5.K1), DIOT_signal_routing (T_R64.1)
BP_IO.LVDS_N14: CPCIS_Connectors_P1_P6 (T_J5.H1), DIOT_signal_routing (T_R65.1)
BP_IO.LVDS_N15: CPCIS_Connectors_P1_P6 (T_J4.F2), DIOT_signal_routing (T_R66.2)
BP_IO.LVDS_P0: CPCIS_Connectors_P1_P6 (T_J4.D3), DIOT_signal_routing (T_R35.1)
BP_IO.LVDS_P1: CPCIS_Connectors_P1_P6 (T_J4.A3), DIOT_signal_routing (T_R36.1)
BP_IO.LVDS_P2: CPCIS_Connectors_P1_P6 (T_J4.B4), DIOT_signal_routing (T_R37.1)
BP_IO.LVDS_P3: CPCIS_Connectors_P1_P6 (T_J4.K4), DIOT_signal_routing (T_R38.1)
BP_IO.LVDS_P4: CPCIS_Connectors_P1_P6 (T_J4.H4), DIOT_signal_routing (T_R39.1)
BP_IO.LVDS_P5: CPCIS_Connectors_P1_P6 (T_J4.J5), DIOT_signal_routing (T_R40.1)
BP_IO.LVDS_P6: CPCIS_Connectors_P1_P6 (T_J4.G5), DIOT_signal_routing (T_R41.1)
BP_IO.LVDS_P7: CPCIS_Connectors_P1_P6 (T_J4.E6), DIOT_signal_routing (T_R42.1)
BP_IO.LVDS_P8: CPCIS_Connectors_P1_P6 (T_J4.B6), DIOT_signal_routing (T_R43.1)
BP_IO.LVDS_P9: CPCIS_Connectors_P1_P6 (T_J4.K6), DIOT_signal_routing (T_R44.1)
BP_IO.LVDS_P10: CPCIS_Connectors_P1_P6 (T_J4.H6), DIOT_signal_routing (T_R45.1)
BP_IO.LVDS_P11: CPCIS_Connectors_P1_P6 (T_J5.D1), DIOT_signal_routing (T_R46.1)
BP_IO.LVDS_P12: CPCIS_Connectors_P1_P6 (T_J5.A1), DIOT_signal_routing (T_R47.1)
BP_IO.LVDS_P13: CPCIS_Connectors_P1_P6 (T_J5.J1), DIOT_signal_routing (T_R48.1)
BP_IO.LVDS_P14: CPCIS_Connectors_P1_P6 (T_J5.G1), DIOT_signal_routing (T_R49.1)
BP_IO.LVDS_P15: CPCIS_Connectors_P1_P6 (T_J4.E2), DIOT_signal_routing (T_R50.2)
BP_JTAG.TCK: FPGA_Config (IC6.3), JTAG_Switch (IC33.10)
BP_JTAG.TDI: FPGA_Config (IC6.13), JTAG_Switch (IC33.15)
BP_JTAG.TDO: FPGA_Config (IC6.10), JTAG_Switch (IC38.2)
BP_JTAG.TMS: FPGA_Config (IC6.6), JTAG_Switch (IC33.11)
CH0_GAIN_A0: FPGA_Bank34 (IC4#1.AB5), U_Input_channel0 (IC16A.4)
CH0_GAIN_A1: FPGA_Bank34 (IC4#1.AA5), U_Input_channel0 (IC16A.5)
CH1_GAIN_A0: FPGA_Bank34 (IC4#1.AA6), U_Input_channel1 (IC16B.4)
CH1_GAIN_A1: FPGA_Bank34 (IC4#1.AB6), U_Input_channel1 (IC16B.5)
CK_GTP_N: FPGA_GTP (IC4#2.E6), CLK_GEN (C27.1)
CK_GTP_P: FPGA_GTP (IC4#2.F6), CLK_GEN (C26.1)
CPCIS_CLK_N: FPGA_GTP (J9.17), CLK_GEN (R70.1)
CPCIS_CLK_P: FPGA_GTP (J9.15), CLK_GEN (R56.1)
DAC_ALARM: FPGA_Bank34 (IC4#1.AB8), DAC (U1.N12)
DAC_CLK_N: CLK_GEN (C4.1), DAC (R88.2 U1.A11)
DAC_CLK_P: CLK_GEN (C3.1), DAC (R88.1 U1.A12)
DAC_RESETB: FPGA_Bank34 (IC4#1.Y7), DAC (R36.2 U1.N10)
DAC_SCLK: FPGA_Bank34 (IC4#1.U7), DAC (B9.1 U1.P9)
DAC_SDENB: FPGA_Bank34 (IC4#1.Y9), DAC (B12.1 U1.P10)
DAC_SDIO: FPGA_Bank34 (IC4#1.W9), DAC (B10.1 U1.P11)
DAC_SDO: FPGA_Bank34 (IC4#1.AA8), DAC (B11.1 U1.P12)
DAC_SLEEP: FPGA_Bank34 (IC4#1.Y8), DAC (R231.1 U1.N11)
DAC_TXENA: FPGA_Bank34 (IC4#1.V8), DAC (B13.1 U1.N9)
DATA_CLK_N: FPGA_Bank15-16 (IC4#1.D22), DAC (U1.G1)
DATA_CLK_P: FPGA_Bank15-16 (IC4#1.E22), DAC (U1.G2)
EEM0_I2C.SCL: DIOT_signal_routing (T_IC8.3), EEM_Connectors (T_D1.3 T_IC2.1 T_IC3.6 T_J1.27), Temperature_monitoring (T_IC6.1 T_IC16.1), U_FPGA/U_I2C switch_0 (T_IC9A.6), JTAG_Switch (IC10.1)
EEM0_I2C.SDA: DIOT_signal_routing (T_IC8.2), EEM_Connectors (T_D1.1 T_IC2.3 T_IC3.5 T_J1.26), Temperature_monitoring (T_IC6.6 T_IC16.6), U_FPGA/U_I2C switch_0 (T_IC9A.7), JTAG_Switch (IC10.2)
EEM0_INT_I2C.SCL: FPGA_Bank34 (IC4#1.AB1), U_FPGA/U_I2C switch_0 (T_IC9A.3 T_R68A.1)
EEM0_INT_I2C.SDA: FPGA_Bank34 (IC4#1.AA1), U_FPGA/U_I2C switch_0 (T_IC9A.2 T_R67A.1)
EEM1_I2C.SCL: EEM_Connectors (T_D1.6 T_IC4.1 T_IC5.6 T_J2.27), U_FPGA/U_I2C switch_1 (T_IC9B.6)
EEM1_I2C.SDA: EEM_Connectors (T_D1.4 T_IC4.3 T_IC5.5 T_J2.26), U_FPGA/U_I2C switch_1 (T_IC9B.7)
EEM1_INT_I2C.SCL: FPGA_Bank34 (IC4#1.Y2), U_FPGA/U_I2C switch_1 (T_IC9B.3 T_R68B.1)
EEM1_INT_I2C.SDA: FPGA_Bank34 (IC4#1.Y3), U_FPGA/U_I2C switch_1 (T_IC9B.2 T_R67B.1)
EEM_IO.LVDS_N0: DIOT_signal_routing (T_R51.2), EEM_Connectors (T_J1.3), JTAG_Switch (IC26.7)
EEM_IO.LVDS_N1: DIOT_signal_routing (T_R52.2), EEM_Connectors (T_J1.6), JTAG_Switch (IC17.7)
EEM_IO.LVDS_N2: DIOT_signal_routing (T_R53.2), EEM_Connectors (T_J1.9), JTAG_Switch (IC17.4)
EEM_IO.LVDS_N3: DIOT_signal_routing (T_R54.2), EEM_Connectors (T_J1.12), FPGA_Bank13-14 (IC4#1.T18)
EEM_IO.LVDS_N4: DIOT_signal_routing (T_R55.2), EEM_Connectors (T_J1.15), JTAG_Switch (IC26.4)
EEM_IO.LVDS_N5: DIOT_signal_routing (T_R56.2), EEM_Connectors (T_J1.18), FPGA_Bank13-14 (IC4#1.R19)
EEM_IO.LVDS_N6: DIOT_signal_routing (T_R57.2), EEM_Connectors (T_J1.21), FPGA_Bank13-14 (IC4#1.V19)
EEM_IO.LVDS_N7: DIOT_signal_routing (T_R58.2), EEM_Connectors (T_J1.24), FPGA_Bank13-14 (IC4#1.W17)
EEM_IO.LVDS_N8: DIOT_signal_routing (T_R59.2), EEM_Connectors (T_J2.3), FPGA_Bank13-14 (IC4#1.Y19)
EEM_IO.LVDS_N9: DIOT_signal_routing (T_R60.2), EEM_Connectors (T_J2.6), FPGA_Bank13-14 (IC4#1.AB20)
EEM_IO.LVDS_N10: DIOT_signal_routing (T_R61.2), EEM_Connectors (T_J2.9), FPGA_Bank13-14 (IC4#1.AA21)
EEM_IO.LVDS_N11: DIOT_signal_routing (T_R62.2), EEM_Connectors (T_J2.12), FPGA_Bank13-14 (IC4#1.AB18)
EEM_IO.LVDS_N12: DIOT_signal_routing (T_R63.2), EEM_Connectors (T_J2.15), FPGA_Bank13-14 (IC4#1.AB22)
EEM_IO.LVDS_N13: DIOT_signal_routing (T_R64.2), EEM_Connectors (T_J2.18), FPGA_Bank13-14 (IC4#1.Y22)
EEM_IO.LVDS_N14: DIOT_signal_routing (T_R65.2), EEM_Connectors (T_J2.21), FPGA_Bank13-14 (IC4#1.U18)
EEM_IO.LVDS_N15: DIOT_signal_routing (T_R66.1), EEM_Connectors (T_J2.24), FPGA_Bank13-14 (IC4#1.R14)
EEM_IO.LVDS_P0: DIOT_signal_routing (T_R35.2), EEM_Connectors (T_J1.2), JTAG_Switch (IC26.8)
EEM_IO.LVDS_P1: DIOT_signal_routing (T_R36.2), EEM_Connectors (T_J1.5), JTAG_Switch (IC17.8)
EEM_IO.LVDS_P2: DIOT_signal_routing (T_R37.2), EEM_Connectors (T_J1.8), JTAG_Switch (IC17.3)
EEM_IO.LVDS_P3: DIOT_signal_routing (T_R38.2), EEM_Connectors (T_J1.11), FPGA_Bank13-14 (IC4#1.R18)
EEM_IO.LVDS_P4: DIOT_signal_routing (T_R39.2), EEM_Connectors (T_J1.14), JTAG_Switch (IC26.3)
EEM_IO.LVDS_P5: DIOT_signal_routing (T_R40.2), EEM_Connectors (T_J1.17), FPGA_Bank13-14 (IC4#1.P19)
EEM_IO.LVDS_P6: DIOT_signal_routing (T_R41.2), EEM_Connectors (T_J1.20), FPGA_Bank13-14 (IC4#1.V18)
EEM_IO.LVDS_P7: DIOT_signal_routing (T_R42.2), EEM_Connectors (T_J1.23), FPGA_Bank13-14 (IC4#1.V17)
EEM_IO.LVDS_P8: DIOT_signal_routing (T_R43.2), EEM_Connectors (T_J2.2), FPGA_Bank13-14 (IC4#1.Y18)
EEM_IO.LVDS_P9: DIOT_signal_routing (T_R44.2), EEM_Connectors (T_J2.5), FPGA_Bank13-14 (IC4#1.AA19)
EEM_IO.LVDS_P10: DIOT_signal_routing (T_R45.2), EEM_Connectors (T_J2.8), FPGA_Bank13-14 (IC4#1.AA20)
EEM_IO.LVDS_P11: DIOT_signal_routing (T_R46.2), EEM_Connectors (T_J2.11), FPGA_Bank13-14 (IC4#1.AA18)
EEM_IO.LVDS_P12: DIOT_signal_routing (T_R47.2), EEM_Connectors (T_J2.14), FPGA_Bank13-14 (IC4#1.AB21)
EEM_IO.LVDS_P13: DIOT_signal_routing (T_R48.2), EEM_Connectors (T_J2.17), FPGA_Bank13-14 (IC4#1.Y21)
EEM_IO.LVDS_P14: DIOT_signal_routing (T_R49.2), EEM_Connectors (T_J2.20), FPGA_Bank13-14 (IC4#1.U17)
EEM_IO.LVDS_P15: DIOT_signal_routing (T_R50.1), EEM_Connectors (T_J2.23), FPGA_Bank13-14 (IC4#1.P14)
EEM_IO_INT.LVDS_N0: FPGA_Bank13-14 (IC4#1.W20), JTAG_Switch (IC26.17)
EEM_IO_INT.LVDS_N1: FPGA_Bank13-14 (IC4#1.U21), JTAG_Switch (IC17.17)
EEM_IO_INT.LVDS_N2: FPGA_Bank13-14 (IC4#1.W22), JTAG_Switch (IC17.18)
EEM_IO_INT.LVDS_N4: FPGA_Bank13-14 (IC4#1.V20), JTAG_Switch (IC26.18)
EEM_IO_INT.LVDS_P0: FPGA_Bank13-14 (IC4#1.W19), JTAG_Switch (IC26.16)
EEM_IO_INT.LVDS_P1: FPGA_Bank13-14 (IC4#1.T21), JTAG_Switch (IC17.16)
EEM_IO_INT.LVDS_P2: FPGA_Bank13-14 (IC4#1.W21), JTAG_Switch (IC17.19)
EEM_IO_INT.LVDS_P4: FPGA_Bank13-14 (IC4#1.U20), JTAG_Switch (IC26.19)
FAN_PWM: FPGA (C368.2), FPGA_Bank13-14 (IC4#1.P20)
FPGA_CFG.FLASH_D2: FPGA_Bank13-14 (IC4#1.P21), FPGA_Config (IC39.9 R295.1)
FPGA_CFG.FLASH_D3: FPGA_Bank13-14 (IC4#1.R21), FPGA_Config (IC39.1 R296.1)
FPGA_CFG.FLASH_SDI_D0: FPGA_Bank13-14 (IC4#1.P22), FPGA_Config (IC39.15)
FPGA_CFG.FLASH_SDO_D1: FPGA_Bank13-14 (IC4#1.R22), FPGA_Config (IC39.8)
FPGA_CFG.FLASH_SS: FPGA_Bank13-14 (IC4#1.T19), FPGA_Config (IC39.7 R297.1)
FPGA_CFG.FPGA_DONE: LEDs (T4.1), FPGA_Config (IC4#1.G11 R57.2)
GA0: Power-up_delay (T_R31.1 T_T2.1), CPCIS_Connectors_P1_P6 (T_R13.1)
GA1: Power-up_delay (T_R32.1 T_T3.1), CPCIS_Connectors_P1_P6 (T_R14.1)
GA2: Power-up_delay (T_R33.1 T_T4.1), CPCIS_Connectors_P1_P6 (T_R16.1)
GA3: Power-up_delay (T_R34.1 T_T5.1), CPCIS_Connectors_P1_P6 (T_R18.1)
HW_REV0: FPGA (R261.1), FPGA_Bank15-16 (IC4#1.N18)
HW_REV1: FPGA (R235.1), FPGA_Bank15-16 (IC4#1.M17)
HW_REV2: FPGA (R242.1), FPGA_Bank15-16 (IC4#1.M15)
HW_REV3: FPGA (R243.1), FPGA_Bank15-16 (IC4#1.M16)
ISTR_PARITYAB_N: FPGA_Bank15-16 (IC4#1.G22), DAC (U1.H1)
ISTR_PARITYAB_P: FPGA_Bank15-16 (IC4#1.G21), DAC (U1.H2)
LED0: FPGA_Bank13-14 (IC4#1.N17), FP_Connectors (T18.1)
LED1: FPGA_Bank13-14 (IC4#1.P17), FP_Connectors (T19.1)
LED2: FPGA_Bank13-14 (IC4#1.P15), FP_Connectors (T20.1)
LED3: FPGA_Bank13-14 (IC4#1.R16), FP_Connectors (T21.1)
LED4: FPGA_Bank13-14 (IC4#1.N13), FP_Connectors (T22.1)
LED5: FPGA_Bank13-14 (IC4#1.N14), FP_Connectors (T23.1)
LED6: FPGA_Bank13-14 (IC4#1.P16), FP_Connectors (T13.1)
LED7: FPGA_Bank13-14 (IC4#1.R17), FP_Connectors (T2.1)
LVDSA0_N: FPGA_Bank15-16 (IC4#1.F20), DAC (U1.G3)
LVDSA0_P: FPGA_Bank15-16 (IC4#1.F19), DAC (U1.G4)
LVDSA1_N: FPGA_Bank15-16 (IC4#1.D19), DAC (U1.F1)
LVDSA1_P: FPGA_Bank15-16 (IC4#1.E19), DAC (U1.F2)
LVDSA2_N: FPGA_Bank15-16 (IC4#1.E18), DAC (U1.F3)
LVDSA2_P: FPGA_Bank15-16 (IC4#1.F18), DAC (U1.F4)
LVDSA3_N: FPGA_Bank15-16 (IC4#1.C22), DAC (U1.E1)
LVDSA3_P: FPGA_Bank15-16 (IC4#1.B22), DAC (U1.E2)
LVDSA4_N: FPGA_Bank15-16 (IC4#1.C17), DAC (U1.E3)
LVDSA4_P: FPGA_Bank15-16 (IC4#1.D17), DAC (U1.E4)
LVDSA5_N: FPGA_Bank15-16 (IC4#1.A19), DAC (U1.D1)
LVDSA5_P: FPGA_Bank15-16 (IC4#1.A18), DAC (U1.D2)
LVDSA6_N: FPGA_Bank15-16 (IC4#1.E17), DAC (U1.D3)
LVDSA6_P: FPGA_Bank15-16 (IC4#1.F16), DAC (U1.D4)
LVDSA7_N: FPGA_Bank15-16 (IC4#1.D21), DAC (U1.C1)
LVDSA7_P: FPGA_Bank15-16 (IC4#1.E21), DAC (U1.C2)
LVDSA8_N: FPGA_Bank15-16 (IC4#1.D16), DAC (U1.C3)
LVDSA8_P: FPGA_Bank15-16 (IC4#1.E16), DAC (U1.C4)
LVDSA9_N: FPGA_Bank15-16 (IC4#1.C19), DAC (U1.B1)
LVDSA9_P: FPGA_Bank15-16 (IC4#1.C18), DAC (U1.A1)
LVDSA10_N: FPGA_Bank15-16 (IC4#1.B18), DAC (U1.B2)
LVDSA10_P: FPGA_Bank15-16 (IC4#1.B17), DAC (U1.A2)
LVDSA11_N: FPGA_Bank15-16 (IC4#1.D15), DAC (U1.B3)
LVDSA11_P: FPGA_Bank15-16 (IC4#1.D14), DAC (U1.A3)
LVDSA12_N: FPGA_Bank15-16 (IC4#1.E14), DAC (U1.B4)
LVDSA12_P: FPGA_Bank15-16 (IC4#1.E13), DAC (U1.A4)
LVDSA13_N: FPGA_Bank15-16 (IC4#1.F14), DAC (U1.B5)
LVDSA13_P: FPGA_Bank15-16 (IC4#1.F13), DAC (U1.A5)
LVDSA14_N: FPGA_Bank15-16 (IC4#1.B16), DAC (U1.B6)
LVDSA14_P: FPGA_Bank15-16 (IC4#1.B15), DAC (U1.A6)
LVDSA15_N: FPGA_Bank15-16 (IC4#1.C15), DAC (U1.B7)
LVDSA15_P: FPGA_Bank15-16 (IC4#1.C14), DAC (U1.A7)
LVDSB0_N: FPGA_Bank15-16 (IC4#1.G16), DAC (U1.P7)
LVDSB0_P: FPGA_Bank15-16 (IC4#1.G15), DAC (U1.N7)
LVDSB1_N: FPGA_Bank15-16 (IC4#1.M20), DAC (U1.P6)
LVDSB1_P: FPGA_Bank15-16 (IC4#1.N20), DAC (U1.N6)
LVDSB2_N: FPGA_Bank15-16 (IC4#1.G20), DAC (U1.P5)
LVDSB2_P: FPGA_Bank15-16 (IC4#1.H20), DAC (U1.N5)
LVDSB3_N: FPGA_Bank15-16 (IC4#1.H19), DAC (U1.P4)
LVDSB3_P: FPGA_Bank15-16 (IC4#1.J19), DAC (U1.N4)
LVDSB4_N: FPGA_Bank15-16 (IC4#1.H18), DAC (U1.P3)
LVDSB4_P: FPGA_Bank15-16 (IC4#1.H17), DAC (U1.N3)
LVDSB5_N: FPGA_Bank15-16 (IC4#1.L18), DAC (U1.P2)
LVDSB5_P: FPGA_Bank15-16 (IC4#1.M18), DAC (U1.N2)
LVDSB6_N: FPGA_Bank15-16 (IC4#1.J21), DAC (U1.P1)
LVDSB6_P: FPGA_Bank15-16 (IC4#1.J20), DAC (U1.N1)
LVDSB7_N: FPGA_Bank15-16 (IC4#1.H15), DAC (U1.M1)
LVDSB7_P: FPGA_Bank15-16 (IC4#1.J15), DAC (U1.M2)
LVDSB8_N: FPGA_Bank15-16 (IC4#1.L16), DAC (U1.M3)
LVDSB8_P: FPGA_Bank15-16 (IC4#1.K16), DAC (U1.M4)
LVDSB9_N: FPGA_Bank15-16 (IC4#1.L15), DAC (U1.L1)
LVDSB9_P: FPGA_Bank15-16 (IC4#1.L14), DAC (U1.L2)
LVDSB10_N: FPGA_Bank15-16 (IC4#1.K14), DAC (U1.L3)
LVDSB10_P: FPGA_Bank15-16 (IC4#1.K13), DAC (U1.L4)
LVDSB11_N: FPGA_Bank15-16 (IC4#1.J17), DAC (U1.K1)
LVDSB11_P: FPGA_Bank15-16 (IC4#1.K17), DAC (U1.K2)
LVDSB12_N: FPGA_Bank15-16 (IC4#1.H14), DAC (U1.K3)
LVDSB12_P: FPGA_Bank15-16 (IC4#1.J14), DAC (U1.K4)
LVDSB13_N: FPGA_Bank15-16 (IC4#1.L20), DAC (U1.J1)
LVDSB13_P: FPGA_Bank15-16 (IC4#1.L19), DAC (U1.J2)
LVDSB14_N: FPGA_Bank15-16 (IC4#1.G13), DAC (U1.J3)
LVDSB14_P: FPGA_Bank15-16 (IC4#1.H13), DAC (U1.J4)
LVDSB15_N: FPGA_Bank15-16 (IC4#1.L13), DAC (U1.H3)
LVDSB15_P: FPGA_Bank15-16 (IC4#1.M13), DAC (U1.H4)
NetC11_1: FP_Connectors (C11.1 J13.2 R156.2), U_Input_channel0 (IC27A.6 L2A.2 R98A.1 SW1A.4)
NetC31_1: FP_Connectors (C31.1 J15.2 R157.2), U_Input_channel1 (L2B.1 R8B.1 R83B.2)
NetC37_1: FP_Connectors (C37.1 J2.2 R14.2 R150.2), CLK_GEN (R81.2 R245.1 TR2.6)
NetC133A_1: U_Upconversion0 (C133A.1 R226A.1), Upconversion_LO (J16.1)
NetC133B_1: Upconversion_LO (IC34.2 R257.1), U_Upconversion1 (C133B.1 R226B.1)
NetC196_2: FP_Connectors (J2.1), CLK_GEN (C196.2)
NetC270A_2: DAC (R252.1), U_Attenuator0 (C270A.2)
NetC270B_2: DAC (R249.1), U_Attenuator1 (C270B.2)
NetC270C_2: DAC (R247.1), U_Attenuator2 (C270C.2)
NetC270D_2: DAC (R246.1), U_Attenuator3 (C270D.2)
NetC272A_1: FP_Connectors (J5.1), U_Attenuator0 (C272A.1 C370A.2)
NetC272B_1: FP_Connectors (J6.1), U_Attenuator1 (C272B.1 C370B.2)
NetC272C_1: FP_Connectors (J3.1), U_Attenuator2 (C272C.1 C370C.2)
NetC272D_1: FP_Connectors (J4.1), U_Attenuator3 (C272D.1 C370D.2)
NetC354A_1: U_Upconversion0 (C354A.1), Upconversion_LO (IC34.1 R257.2)
NetC354B_1: Upconversion_LO (J17.1), U_Upconversion1 (C354B.1)
NetC369A_1: U_Upconversion0 (IC2A.18), U_Attenuator0 (C369A.1)
NetC369B_1: U_Upconversion1 (IC2B.18), U_Attenuator1 (C369B.1)
NetIC7_3: Power_main_DCDC (R60.1 R87.1 R130.1), Power_AFE_DCDC (IC7.3 IC18.3)
NetIC27B_6: FP_Connectors (J15.1), U_Input_channel1 (IC27B.6 L2B.2 R98B.1 SW1B.4)
NetJ13_1: FP_Connectors (J13.1), U_Input_channel0 (L2A.1 R8A.1 R83A.2)
OSTR_N: FPGA_Bank15-16 (IC4#1.B13), DAC (C360.2)
OSTR_P: FPGA_Bank15-16 (IC4#1.C13), DAC (C363.2)
PARITYCD_N: FPGA_Bank15-16 (IC4#1.G18), DAC (U1.P8)
PARITYCD_P: FPGA_Bank15-16 (IC4#1.G17), DAC (U1.N8)
PGOOD: Power_main_DCDC (5 pins), LEDs (T_T1.1)
PSU_EN: Power_Supplies (T_R8.1), Power-up_delay (T_IC7.1), Power_main_DCDC (IC22.38), LEDs (LD7.3), Temperature_monitoring (T_IC6.3 T_IC16.3), JTAG_Switch (T28.3)
REF_~{SHDN}: Power_main_DCDC (R60.2), ADC_2CH (R90.2)
RSTn: Power-up_delay (T_D6.1), CPCIS_Connectors_P1_P6 (T_R15.1)
SERVMOD_3V3: CPCIS_Connectors_P1_P6 (T_R17.1 T_R19.2), DIOT_signal_routing (T_IC8.5), JTAG_Switch (R282.1 T30.1)
SERVMOD_JTAG: FPGA_Config (IC6.1), JTAG_Switch (5 pins)
SMA_CLK_SEL: FPGA_Bank13-14 (IC4#1.T20), CLK_GEN (SW2.1)
SYNC_N: FPGA_Bank15-16 (IC4#1.A14), DAC (U1.B8)
SYNC_P: FPGA_Bank15-16 (IC4#1.A13), DAC (U1.A8)
TACHO: FPGA (R277.2), FPGA_Bank13-14 (IC4#1.V22)
TERM_EN0: FPGA_Bank15-16 (IC4#1.J16), U_Input_channel0 (R237A.2 T26A.1)
TERM_EN1: FPGA_Bank15-16 (IC4#1.F15), U_Input_channel1 (R237B.2 T26B.1)
TERM_STAT0n: FPGA_SDRAM (T24.1), FP_Connectors (LD23.1), U_Input_channel0 (IC27A.3 R192A.1 T26A.3 T27A.3)
TERM_STAT1n: FPGA_SDRAM (T25.1), FP_Connectors (LD23.3), U_Input_channel1 (IC27B.3 R192B.1 T26B.3 T27B.3)
TRF_CLK: FPGA_Bank34 (IC4#1.U3), U_Upconversion0 (B16A.1 IC2A.47)
TRF_CLK: FPGA_Bank34 (IC4#1.Y1), U_Upconversion1 (B16B.1 IC2B.47)
TRF_DATA: FPGA_Bank34 (IC4#1.W1), U_Upconversion1 (B15B.1 IC2B.46)
TRF_DATA: FPGA_Bank34 (IC4#1.T3), U_Upconversion0 (B15A.1 IC2A.46)
TRF_LD: FPGA_Bank34 (IC4#1.V2), U_Upconversion1 (B17B.1 IC2B.5)
TRF_LD: FPGA_Bank34 (IC4#1.U2), U_Upconversion0 (B17A.1 IC2A.5)
TRF_LE: FPGA_Bank34 (IC4#1.W2), U_Upconversion1 (B14B.1 IC2B.45)
TRF_LE: FPGA_Bank34 (IC4#1.T1), U_Upconversion0 (B14A.1 IC2A.45)
TRF_PS: FPGA_Bank34 (IC4#1.W7), U_Upconversion1 (B19B.1 IC2B.1)
TRF_PS: FPGA_Bank34 (IC4#1.U1), U_Upconversion0 (B19A.1 IC2A.1)
TRF_RDBK: FPGA_Bank34 (IC4#1.V9), U_Upconversion0 (B18A.1 IC2A.2)
TRF_RDBK: FPGA_Bank34 (IC4#1.V7), U_Upconversion1 (B18B.1 IC2B.2)
UART_RX: FPGA (D4.3 W1.2), FPGA_Bank34 (IC4#1.AB3)
UART_TX: FPGA (D4.1 W1.3), FPGA_Bank34 (IC4#1.Y4)
UPC_REF_CLK_N: CLK_GEN (C13.1), U_Upconversion1 (C281B.1 TR6B.1)
UPC_REF_CLK_N: CLK_GEN (C9.1), U_Upconversion0 (C281A.1 TR6A.1)
UPC_REF_CLK_P: CLK_GEN (C12.1), U_Upconversion1 (C280B.2 TR6B.3)
UPC_REF_CLK_P: CLK_GEN (C5.1), U_Upconversion0 (C280A.2 TR6A.3)
XADC_GND: FPGA_Supply (C50.1 C51.1 IC4#1.K9 L5.2), FPGA_Config (IC4#1.L9 IC4#1.L10 IC4#1.M9 IC4#1.M10)